# Altium schematic sheet Sheet1practice.SchDoc
size A4; SheetNumber: 1; SheetTotal: 1; SPICEModelCacheHFLONPGZ: <root> / <DocumentId>HFLONPGZ</DocumentId> / <CacheFrame Number="0"> / <Model Name="3mm_151031ss04000" Kind="CKT"> / <Text>************************************************** / * Manufacturer:           Wurth Elektronik / * Kinds:                  THT Mono-color Round Color / * Matchcode:              WL-TMRC / * Library Type:           LTspice / * Version:                rev22a / * Created/modified by:    Ella / * Date and Time:          2022-02-23 / * Team:                   eiSos EDA Service / * Contact:                libraries@we-online.com / ************************************************** / * Copyright(C) 2022 WÃ¼rth Elektronik eiSos GmbH &amp; Co. KG / * All Rights Reserved. / ************************************************** / * Disclaimer: While WÃ¼rth Elektronik eiSos has made every reasonable effort to ensure the accuracy / * of the simulation models provided, WÃ¼rth Elektronik eiSos does not guarantee the exemption of error on / * the simulation models, nor does WÃ¼rth Elektronik eiSos guarantee that the simulation model is current. / * WÃ¼rth Elektronik eiSos reserves the right to make any adjustments at any time without notice. / * WÃ¼rth Elektronik eiSos expressly disclaims all implied warranties regarding this simulation model. / ************************************************** / .subckt 3mm_151031SS04000  1  2 / D1 1 2 TMRC / .MODEL TMRC D / + IS=10.010E-21 / + N=1.8860 / + RS=1.0000E-6 / + IKF=1.0000E3 / + CJO=1.0000E-12 / + M=.3333 / + VJ=.75 / + BV=5 / + IBV=10.00E-6 / + TT=5.0000E-9 / .ends</Text> / </Model> / </CacheFrame> / </root>
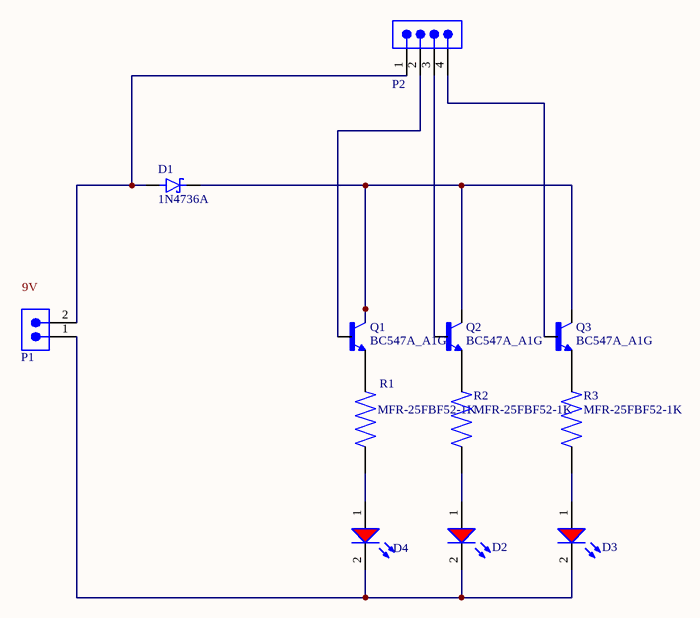
[diagram p0: Sheet1practice.SchDoc]

## Parts
D1  1N4736A  [DIOAD1036W78L463D237]
D2  Super Red, 2V, 40°  [WL-TMRC_D3.95H5.3]  (value not drawn)
D3  Super Red, 2V, 40°  [WL-TMRC_D3.95H5.3]  (value not drawn)
D4  Super Red, 2V, 40°  [WL-TMRC_D3.95H5.3]  (value not drawn)
P1  61300211121  [61300211121]  (value not drawn)
P2  61300411121  [61300411121]  (value not drawn)
Q1  BC547A_A1G  [TO92250P510H770-3]
Q2  BC547A_A1G  [TO92250P510H770-3]
Q3  BC547A_A1G  [TO92250P510H770-3]
R1  MFR-25FBF52-1K  [RESAD1100W55L680D260]
R2  MFR-25FBF52-1K  [RESAD1100W55L680D260]
R3  MFR-25FBF52-1K  [RESAD1100W55L680D260]

## Nets
NetD1_1: D1.1(K) Q1.1(C) Q2.1(C) Q3.1(C)
NetD1_2: D1.2(A) P1.2 P2.1
NetD2_1: D2.1(A) R2.1
NetD2_2: D2.2(K) D3.2(K) D4.2(K) P1.1
NetD3_1: D3.1(A) R3.1
NetD4_1: D4.1(A) R1.1
NetP2_2: P2.2 Q1.2(B)
NetP2_3: P2.3 Q2.2(B)
NetP2_4: P2.4 Q3.2(B)
NetQ1_3: Q1.3(E) R1.2
NetQ2_3: Q2.3(E) R2.2
NetQ3_3: Q3.3(E) R3.2

## Notes on the sheet
- Labels drawn without touching a wire or pin: 9V

## Library data of the parts
D1 = 1N4736A: 1N4736 Series 1 W 6.8 V 10 uA Axial Through Hole Zener Diode - DO-41; MF: ON Semiconductor; SnapEDA_Link: https://www.snapeda.com/parts/1N4736A/Onsemi/view-part/?ref=snap; Package: DO-41 Fairchild Semiconductor; Value: *; MP: 1N4736A; Check_prices: https://www.snapeda.com/parts/1N4736A/Onsemi/view-part/?ref=eda
D2-D4 = 151031SS04000: WL-TMRC Mono-color Round Color, THT, D3.95 x H5.3mm, Super Red, 2V, 40°; Manufacturer: Wurth Elektronik; Case/Size Code: 3mm; Chip Technology: AlInGaP; Dominant Wavelength: 635nm; Luminous Intensity: 160mcd; Peak Wavelength: 640nm; Manufacturer Part Number: 151031SS04000; Category: Signal LEDs; Match Code: WL-TMRC; ComponentLink1Description: Website Link; ComponentLink1URL: https://www.we-online.com/redexpert/article/151031SS04000?ad; ComponentLink2Description: Datasheet Link; ComponentLink2URL: https://www.we-online.com/redexpert/spec/151031SS04000?ad; Mount: Through Hole; Operating Temperature Max: 85°C; Operating Temperature Min: -40°C; Packaging: Bulk; Height: 5.3mm; Diameter: 3.95mm; Emitting Color: Super Red; Forward Voltage: 2V; Viewing Angle: 40°
P1 = 61300211121: WR-PHD Pin Header, THT, Vertical, pitch 2.54mm, 1 Row, 2P; Manufacturer: Wurth Elektronik; Contact Resistance: 20mOhm; Rated Current: 3A; Working Voltage: 250V; Withstanding Voltage: 500V; Manufacturer Part Number: 61300211121; Category: Board-to-Board Connectors; Match Code: WR-PHD; ComponentLink1Description: Website Link; ComponentLink1URL: https://www.we-online.com/redexpert/article/61300211121?ad; ComponentLink2Description: Datasheet Link; ComponentLink2URL: https://www.we-online.com/redexpert/spec/61300211121?ad; Mount: Through Hole; Operating Temperature Max: 105°C; Operating Temperature Min: -40°C; Packaging: Bag; Gender: Pin Header; Number of Pins: 2; Number of Rows: 1; Orientation: Vertical; Pitch: 2.54mm
P2 = 61300411121: WR-PHD Pin Header, THT, Vertical, pitch 2.54mm, 1 Row, 4P; Manufacturer: Wurth Elektronik; Contact Resistance: 20mOhm; Rated Current: 3A; Working Voltage: 250V; Withstanding Voltage: 500V; Manufacturer Part Number: 61300411121; Category: Board-to-Board Connectors; Match Code: WR-PHD; ComponentLink1Description: Website Link; ComponentLink1URL: https://www.we-online.com/redexpert/article/61300411121?ad; ComponentLink2Description: Datasheet Link; ComponentLink2URL: https://www.we-online.com/redexpert/spec/61300411121?ad; Mount: Through Hole; Operating Temperature Max: 105°C; Operating Temperature Min: -40°C; Packaging: Bag; Gender: Pin Header; Number of Pins: 4; Number of Rows: 1; Orientation: Vertical; Pitch: 2.54mm
Q1-Q3 = BC547A_A1G: TO-92, 50V, 0.1A, NPN Bipolar Transistor; MF: Taiwan Semiconductor Corporation; MP: BC547A A1G; Availability: In Stock; SnapEDA_Link: https://www.snapeda.com/parts/BC547A%20A1G/Taiwan+Semiconductor/view-part/?ref=snap; Purchase-URL: https://pricing.snapeda.com/search/part/BC547A A1G/?ref=eda; Price: None; Check_prices: https://www.snapeda.com/parts/BC547A%20A1G/Taiwan+Semiconductor/view-part/?ref=eda; Package: TO-92 Taiwan Semiconductor; Value: *
R1-R3 = MFR-25FBF52-1K: 1.07 kOhms Â±1% 0.25W, 1/4W Through Hole Resistor Axial - Metal Film; MF: Yageo; SnapEDA_Link: https://www.snapeda.com/parts/MFR-25FBF52-1K/Yageo/view-part/?ref=snap; Package: RADIAL-2 YAGEO; Value: *; MP: MFR-25FBF52-1K; Check_prices: https://www.snapeda.com/parts/MFR-25FBF52-1K/Yageo/view-part/?ref=eda